# Altium schematic sheet RP2350.SchDoc
size A4; SheetNumber: 2; SheetTotal: 4
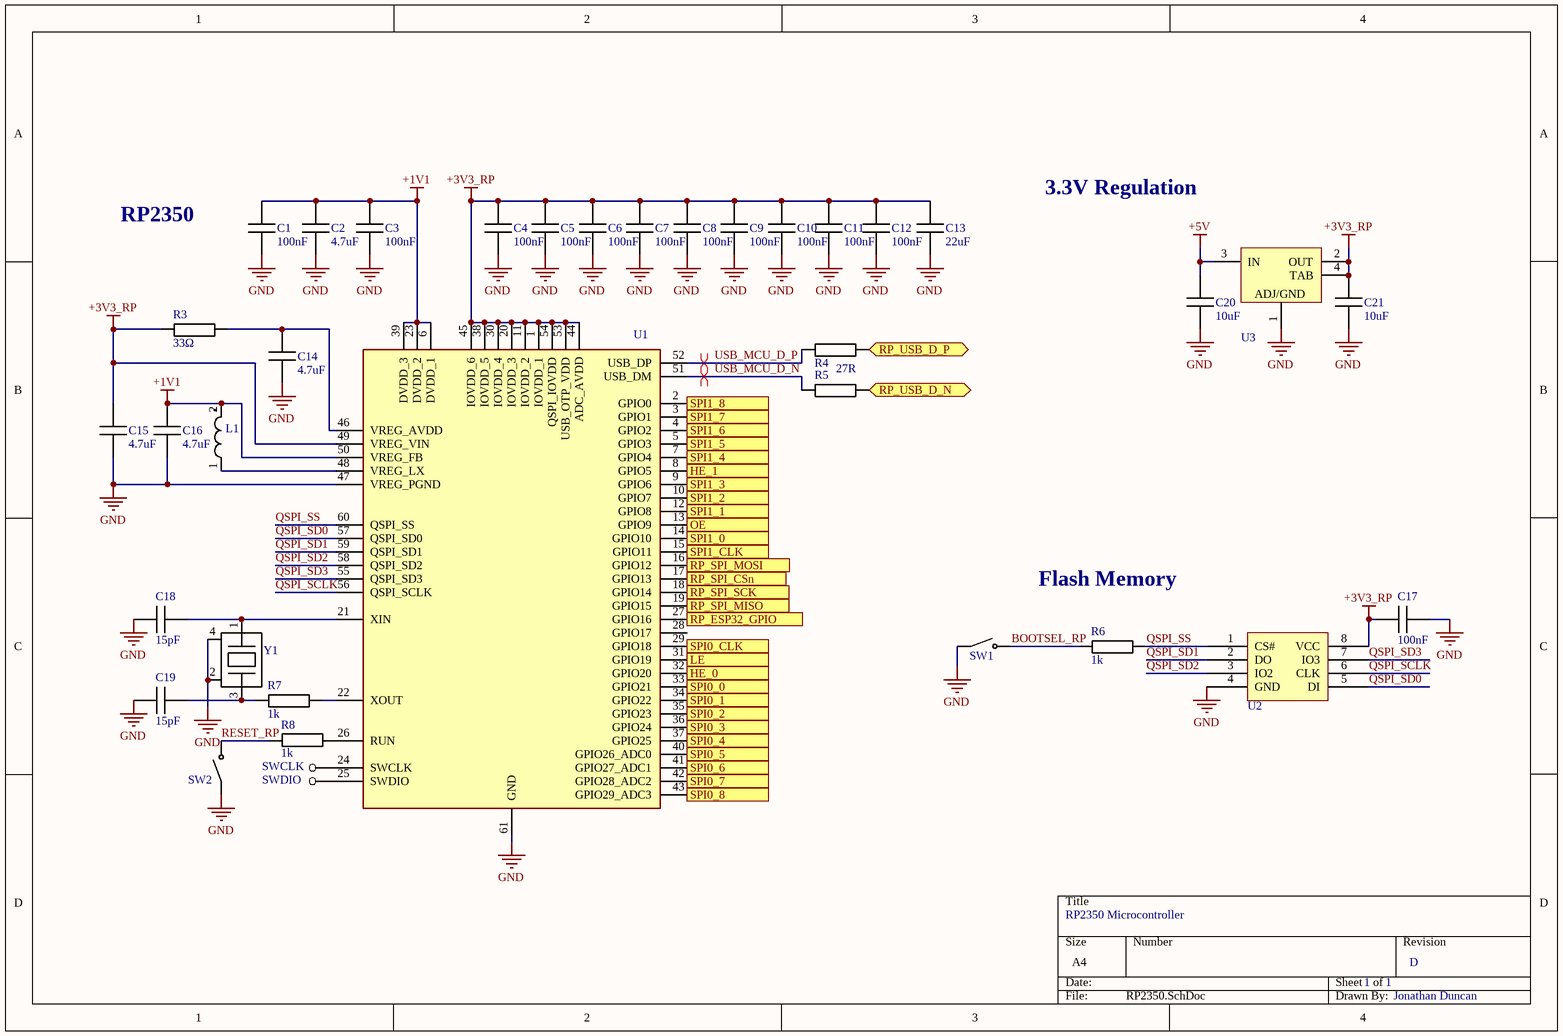
[diagram p0: RP2350.SchDoc]

## Parts
C1  value 100nF  [FP-CC0603-DA-IPC_B]  (hidden comment: Cap 100nF 0603)
C2  value 4.7uF  [FP-CC0603-DA-IPC_B]  (hidden comment: Cap 4.7uF 0603)
C3  value 100nF  [FP-CC0603-DA-IPC_B]  (hidden comment: Cap 100nF 0603)
C4  value 100nF  [FP-CC0603-DA-IPC_B]  (hidden comment: Cap 100nF 0603)
C5  value 100nF  [FP-CC0603-DA-IPC_B]  (hidden comment: Cap 100nF 0603)
C6  value 100nF  [FP-CC0603-DA-IPC_B]  (hidden comment: Cap 100nF 0603)
C7  value 100nF  [FP-CC0603-DA-IPC_B]  (hidden comment: Cap 100nF 0603)
C8  value 100nF  [FP-CC0603-DA-IPC_B]  (hidden comment: Cap 100nF 0603)
C9  value 100nF  [FP-CC0603-DA-IPC_B]  (hidden comment: Cap 100nF 0603)
C10  value 100nF  [FP-CC0603-DA-IPC_B]  (hidden comment: Cap 100nF 0603)
C11  value 100nF  [FP-CC0603-DA-IPC_B]  (hidden comment: Cap 100nF 0603)
C12  value 100nF  [FP-CC0603-DA-IPC_B]  (hidden comment: Cap 100nF 0603)
C13  value 22uF  [FP-CC0603-DA-IPC_B]  (hidden comment: Cap 22uF 0603)
C14  value 4.7uF  [FP-CC0603-DA-IPC_B]  (hidden comment: Cap 4.7uF 0603)
C15  value 4.7uF  [FP-CC0603-DA-IPC_B]  (hidden comment: Cap 4.7uF 0603)
C16  value 4.7uF  [FP-CC0603-DA-IPC_B]  (hidden comment: Cap 4.7uF 0603)
C17  value 100nF  [FP-CC0603-DA-IPC_B]  (hidden comment: Cap 100nF 0603)
C18  value 15pF  [FP-CC0603-DA-IPC_B]  (hidden comment: Cap 15pF 0603)
C19  value 15pF  [FP-CC0603-DA-IPC_B]  (hidden comment: Cap 15pF 0603)
C20  value 10uF  [FP-CC0603-DA-IPC_B]  (hidden comment: Cap 10uF 0603)
C21  value 10uF  [FP-CC0603-DA-IPC_B]  (hidden comment: Cap 10uF 0603)
L1  AOTA-B201610S3R3-101-T  [AOTA-B201610S3R3-101-T-Footprint-1]  (value not drawn)
R3  value 33Ω  [FP-RC0603-0_55-IPC_B]  (hidden comment: Res 33R 0603)
R4  Res 27R 0603  [FP-RC0603-0_55-IPC_B]  (value not drawn)
R5  value 27R  [FP-RC0603-0_55-IPC_B]  (hidden comment: Res 27R 0603)
R6  value 1k  [FP-RC0603-0_55-IPC_B]  (hidden comment: Res 1k 0603)
R7  value 1k  [FP-RC0603-0_55-IPC_B]  (hidden comment: Res 1k 0603)
R8  value 1k  [FP-RC0603-0_55-IPC_B]  (hidden comment: Res 1k 0603)
SW1  TS-1088-AR02016  [3x4 Tactile Switch]  (value not drawn)
SW2  TS-1088-AR02016  [3x4 Tactile Switch]  (value not drawn)
SWCLK  Test Point 50mil SMD  [Test Point 50mil-Footprint-1]  (value not drawn)  (no BOM)
SWDIO  Test Point 50mil SMD  [Test Point 50mil-Footprint-1]  (value not drawn)  (no BOM)
U1  RP2350A-CT  [RP2350A-CT-Footprint-1]  (value not drawn)
U2  W25Q128JVSIQ  [W25Q128JVSIQ-Footprint-1]  (value not drawn)
U3  NCP1117ST33T3G  [ONSC-SOT-223-4-318H-01_A_V]  (value not drawn)
Y1  ABM8-272-T3  [ABM8-272-T3-Footprint-1]  (value not drawn)

## Ports
HE_0 (in), HE_1 (in), LE (out), OE (out), RP_ESP32_GPIO (out), RP_SPI_CSn (in), RP_SPI_MISO (out), RP_SPI_MOSI (in), RP_SPI_SCK (in), RP_USB_D_N (bidir), RP_USB_D_P (bidir), SPI0_0 (out), SPI0_1 (out), SPI0_2 (out), SPI0_3 (out), SPI0_4 (out), SPI0_5 (out), SPI0_6 (out), SPI0_7 (out), SPI0_8 (out), SPI0_CLK (out), SPI1_0 (out), SPI1_1 (out), SPI1_2 (out), SPI1_3 (out), SPI1_4 (out), SPI1_5 (out), SPI1_6 (out), SPI1_7 (out), SPI1_8 (out), SPI1_CLK (out)

## Nets
+1V1: C1.2 C2.2 C3.2 C16.2 L1.2 U1.6(DVDD_1) U1.23(DVDD_2) U1.39(DVDD_3) U1.50(VREG_FB)
+3V3_RP: C4.2 C5.2 C6.2 C7.2 C8.2 C9.2 C10.2 C11.2 C12.2 C13.2 C15.2 C17.1 C21.2 R3.1 U1.1(IOVDD_1) U1.11(IOVDD_2) U1.20(IOVDD_3) U1.30(IOVDD_4) U1.38(IOVDD_5) U1.44(ADC_AVDD) U1.45(IOVDD_6) U1.49(VREG_VIN) U1.53(USB_OTP_VDD) U1.54(QSPI_IOVDD) U2.8(VCC) U3.2(OUT) U3.4(TAB)
+5V: C20.2 U3.3(IN)
GND: C1.1 C2.1 C3.1 C4.1 C5.1 C6.1 C7.1 C8.1 C9.1 C10.1 C11.1 C12.1 C13.1 C14.1 C15.1 C16.1 C17.2 C18.1 C19.2 C20.1 C21.1 SW1.1 SW2.1 U1.47(VREG_PGND) U1.61(GND) U2.4(GND) U3.1(ADJ/GND) Y1.2 Y1.4
BOOTSEL_RP: R6.1 SW1.2
HE_0: U1.32(GPIO20) ; port HE_0
HE_1: U1.8(GPIO5) ; port HE_1
LE: U1.31(GPIO19) ; port LE
OE: U1.13(GPIO9) ; port OE
QSPI_SCLK: U1.56(QSPI_SCLK) U2.6(CLK)
QSPI_SD0: U1.57(QSPI_SD0) U2.5(DI)
QSPI_SD1: U1.59(QSPI_SD1) U2.2(DO)
QSPI_SD2: U1.58(QSPI_SD2) U2.3(IO2)
QSPI_SD3: U1.55(QSPI_SD3) U2.7(IO3)
QSPI_SS: R6.2 U1.60(QSPI_SS) U2.1(CS#)
RESET_RP: R8.2 SW2.2
RP_ESP32_GPIO: U1.27(GPIO16) ; port RP_ESP32_GPIO
RP_SPI_CSn: U1.17(GPIO13) ; port RP_SPI_CSn
RP_SPI_MISO: U1.19(GPIO15) ; port RP_SPI_MISO
RP_SPI_MOSI: U1.16(GPIO12) ; port RP_SPI_MOSI
RP_SPI_SCK: U1.18(GPIO14) ; port RP_SPI_SCK
RP_USB_D_N: R5.2 ; port RP_USB_D_N
RP_USB_D_P: R4.2 ; port RP_USB_D_P
SPI0_0: U1.33(GPIO21) ; port SPI0_0
SPI0_1: U1.34(GPIO22) ; port SPI0_1
SPI0_2: U1.35(GPIO23) ; port SPI0_2
SPI0_3: U1.36(GPIO24) ; port SPI0_3
SPI0_4: U1.37(GPIO25) ; port SPI0_4
SPI0_5: U1.40(GPIO26_ADC0) ; port SPI0_5
SPI0_6: U1.41(GPIO27_ADC1) ; port SPI0_6
SPI0_7: U1.42(GPIO28_ADC2) ; port SPI0_7
SPI0_8: U1.43(GPIO29_ADC3) ; port SPI0_8
SPI0_CLK: U1.29(GPIO18) ; port SPI0_CLK
SPI1_0: U1.14(GPIO10) ; port SPI1_0
SPI1_1: U1.12(GPIO8) ; port SPI1_1
SPI1_2: U1.10(GPIO7) ; port SPI1_2
SPI1_3: U1.9(GPIO6) ; port SPI1_3
SPI1_4: U1.7(GPIO4) ; port SPI1_4
SPI1_5: U1.5(GPIO3) ; port SPI1_5
SPI1_6: U1.4(GPIO2) ; port SPI1_6
SPI1_7: U1.3(GPIO1) ; port SPI1_7
SPI1_8: U1.2(GPIO0) ; port SPI1_8
SPI1_CLK: U1.15(GPIO11) ; port SPI1_CLK
USB_MCU_D_N: R5.1 U1.51(USB_DM)
USB_MCU_D_P: R4.1 U1.52(USB_DP)
NetC14_2: C14.2 R3.2 U1.46(VREG_AVDD)
NetC18_2: C18.2 U1.21(XIN) Y1.1
NetC19_1: C19.1 R7.1 Y1.3
NetL1_1: L1.1 U1.48(VREG_LX)
NetR7_2: R7.2 U1.22(XOUT)
NetR8_1: R8.1 U1.26(RUN)
NetSWCLK_1: SWCLK.1 U1.24(SWCLK)
NetSWDIO_1: SWDIO.1 U1.25(SWDIO)

Not connected (* = marked no-connect by the designer): U1 28(GPIO17)

## Layout directives
differential pair: USB_MCU_D_N, USB_MCU_D_P

## Notes on the sheet
- RP2350
- 3.3V Regulation
- Flash Memory
- RP2350 Microcontroller
- 1
- D
- Jonathan Duncan

## Library data of the parts
C1 C3-C12 C17 = CMP-00006-5: 100nF 50V 10% X7R 0603 SMD Capacitor Decoupling; Temperature Coefficient: X7R; Mounting Technology: SMT; Tolerance: 10%; Case/Package: 0603; Voltage Rating: 50V
C2 C14-C16 = CMP-001-00004-1: 4.7uF 16V 10% X5R 0603 SMD Capacitor; Voltage Rating: 16V; Tolerance: 10%; Temperature Coefficient: X5R; Mounting Technology: SMT; Case/Package: 0603
C13 = CMP-001-00003-1: 22uF 6.3V 20% X5R 0603 SMD Capacitor; Case/Package: 0603; Mounting Technology: SMT; Voltage Rating: 6.3V; Tolerance: 20%; Temperature Coefficient: X5R
C18 C19 = CMP-001-00005-1: 15pF 50V 5% C0G 0603 SMD Capacitor; Mounting Technology: SMT; Voltage Rating: 50V; Tolerance: 5%; Temperature Coefficient: C0G; Case/Package: 0603
C20 C21 = CMP-001-00002-1: 10uF 6.3V 10% X5R 0603 SMD Capacitor; Mounting Technology: SMT; Voltage Rating: 6.3V; Case/Package: 0603; Tolerance: 10%; Temperature Coefficient: X5R
L1 = CMP-00014-3: General Purpose Inductor, 3.3uH, 20%, 1 Element, SMD, 0806; Case/Package: 0806; Tolerance: 20%; Value: 3.3uH
R3 = CMP-009-00016-1: 10R 1% 100mW 0603 SMD Resistor; Tolerance: 0.1%; Power Rating: 100mW; Case/Package: 0603; Mounting Technology: Surface Mount
R4 R5 = CMP-009-00017-1: 27R 1% 100mW 0603 SMD Resistor; Tolerance: 0.1%; Power Rating: 100mW; Mounting Technology: Surface Mount; Case/Package: 0603
  R4: Value: 27R
R6-R8 = CMP-00011-1: 1k 1% 100mW 0603 SMD Resistor; Tolerance: 1%; Case/Package: 0603; Mounting Technology: SMT; Power Rating: 100mW
SW1 SW2 = CMP-002-000002-2: 3*4*2.0 160GF Surface mount no-post tactile switch
SWCLK SWDIO = CMP-00019-2: Simple SMD test point with 50mil diameter circular footprint; Diameter: 50mil
U1 = CMP-00007-7: Rp2350 Cortex-M33 Qfn-60 Ct
U2 = CMP-00013-1: NOR Flash Serial (SPI, Dual SPI, Quad SPI) 3.3V 128M-bit 16M x 8 6ns 8-Pin SOIC Tube; Nominal Supply Voltage (DC): 3V; Memory Format: FLASH
U3 = CMP-00015-1: NCP1117 Series 1 A 3.3 V Fixed Output LDO Positive Voltage Regulator - SOT-223; Max Supply Voltage: 15V; Min Input Voltage: 4.75V; Nominal Output Voltage: 3.3V; Pins: 4
Y1 = CMP-00009-2: Parallel - Fundamental Quartz Crystal, 12MHz Nom; ESR: 50Ω; Frequency Stability: 30ppm; Frequency Tolerance: 0.003%; Load Capacitance: 10pF; Min Operating Temperature: -40°C; Frequency: 12MHz; Mounting Technology: Surface Mount; Max Operating Temperature: 85°C